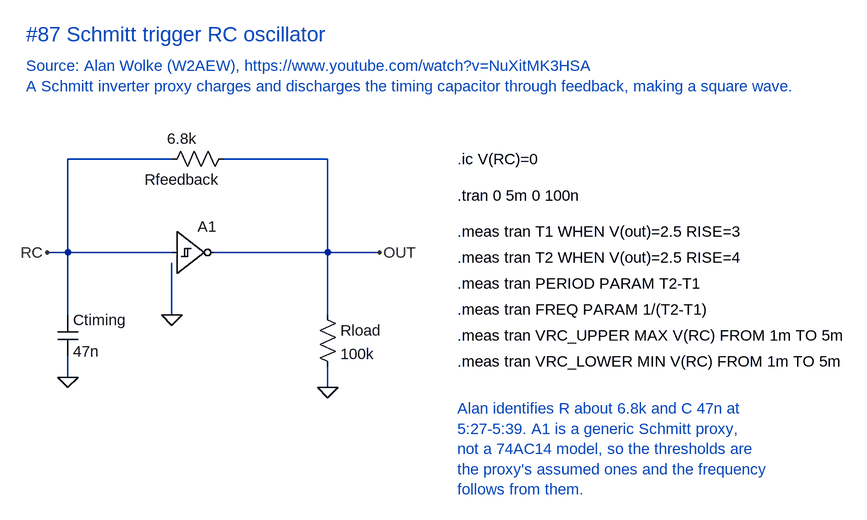
[diagram p0: schematic Schmitt trigger RC oscillator.asc]
Schmitt trigger RC oscillator.asc, the LTspice schematic file:
Version 4.1
SHEET 1 1100 850
WIRE 320 -80 480 -80
WIRE 720 -80 560 -80
WIRE 320 64 320 -80
WIRE 288 64 320 64
WIRE 480 64 320 64
WIRE 720 64 544 64
WIRE 720 64 720 -80
WIRE 800 64 720 64
WIRE 320 160 320 64
WIRE 720 160 720 64
WIRE 480 160 480 80
WIRE 320 256 320 224
WIRE 720 272 720 240
FLAG 288 64 RC
FLAG 800 64 OUT
FLAG 480 160 0
FLAG 320 256 0
FLAG 720 272 0
SYMBOL Digital\schmtinv 480 0 R0
SYMATTR InstName A1
SYMATTR Value2 Vt=2.5 Vh=0.7 Td=10n Trise=10n Tfall=10n
SYMATTR SpiceLine Vhigh=5 Vlow=0
SYMBOL res 464 -64 R270
WINDOW 0 0 32 VBottom 2
WINDOW 3 32 32 VTop 2
SYMATTR InstName Rfeedback
SYMATTR Value 6.8k
SYMBOL cap 304 160 R0
SYMATTR InstName Ctiming
SYMATTR Value 47n
SYMBOL res 704 144 R0
SYMATTR InstName Rload
SYMATTR Value 100k
TEXT 256 -272 Left 3 ;#87 Schmitt trigger RC oscillator
TEXT 256 -224 Left 2 ;Source: Alan Wolke (W2AEW), https://www.youtube.com/watch?v=NuXitMK3HSA
TEXT 256 -192 Left 2 ;A Schmitt inverter proxy charges and discharges the timing capacitor through feedback, making a square wave.
TEXT 920 -80 Left 2 !.ic V(RC)=0
TEXT 920 -24 Left 2 !.tran 0 5m 0 100n
TEXT 920 32 Left 2 !.meas tran T1 WHEN V(out)=2.5 RISE=3
TEXT 920 72 Left 2 !.meas tran T2 WHEN V(out)=2.5 RISE=4
TEXT 920 112 Left 2 !.meas tran PERIOD PARAM T2-T1
TEXT 920 152 Left 2 !.meas tran FREQ PARAM 1/(T2-T1)
TEXT 920 192 Left 2 !.meas tran VRC_UPPER MAX V(RC) FROM 1m TO 5m
TEXT 920 232 Left 2 !.meas tran VRC_LOWER MIN V(RC) FROM 1m TO 5m
TEXT 920 304 Left 2 ;Alan identifies R about 6.8k and C 47n at\n5:27-5:39. A1 is a generic Schmitt proxy,\nnot a 74AC14 model, so the thresholds are\nthe proxy's assumed ones and the frequency\nfollows from them.

The netlist it stands for:
* Schmitt trigger RC oscillator.asc
A1 RC 0 0 0 0 OUT 0 0 SCHMITT Vt=2.5 Vh=0.7 Td=10n Trise=10n Tfall=10n Vhigh=5 Vlow=0
Rfeedback RC OUT 6.8k
Ctiming RC 0 47n
Rload OUT 0 100k
* #87 Schmitt trigger RC oscillator
* Source: Alan Wolke (W2AEW), https://www.youtube.com/watch?v=NuXitMK3HSA
* A Schmitt inverter proxy charges and discharges the timing capacitor through feedback, making a square wave.
.ic V(RC)=0
.tran 0 5m 0 100n
.meas tran T1 WHEN V(out)=2.5 RISE=3
.meas tran T2 WHEN V(out)=2.5 RISE=4
.meas tran PERIOD PARAM T2-T1
.meas tran FREQ PARAM 1/(T2-T1)
.meas tran VRC_UPPER MAX V(RC) FROM 1m TO 5m
.meas tran VRC_LOWER MIN V(RC) FROM 1m TO 5m
* Alan identifies R about 6.8k and C 47n at
* 5:27-5:39. A1 is a generic Schmitt proxy,
* not a 74AC14 model, so the thresholds are
* the proxy's assumed ones and the frequency
* follows from them.
.backanno
.end